# EAGLE design Adafruit RV-8803 RTC Breakout Board (EAGLE 9.6.2)
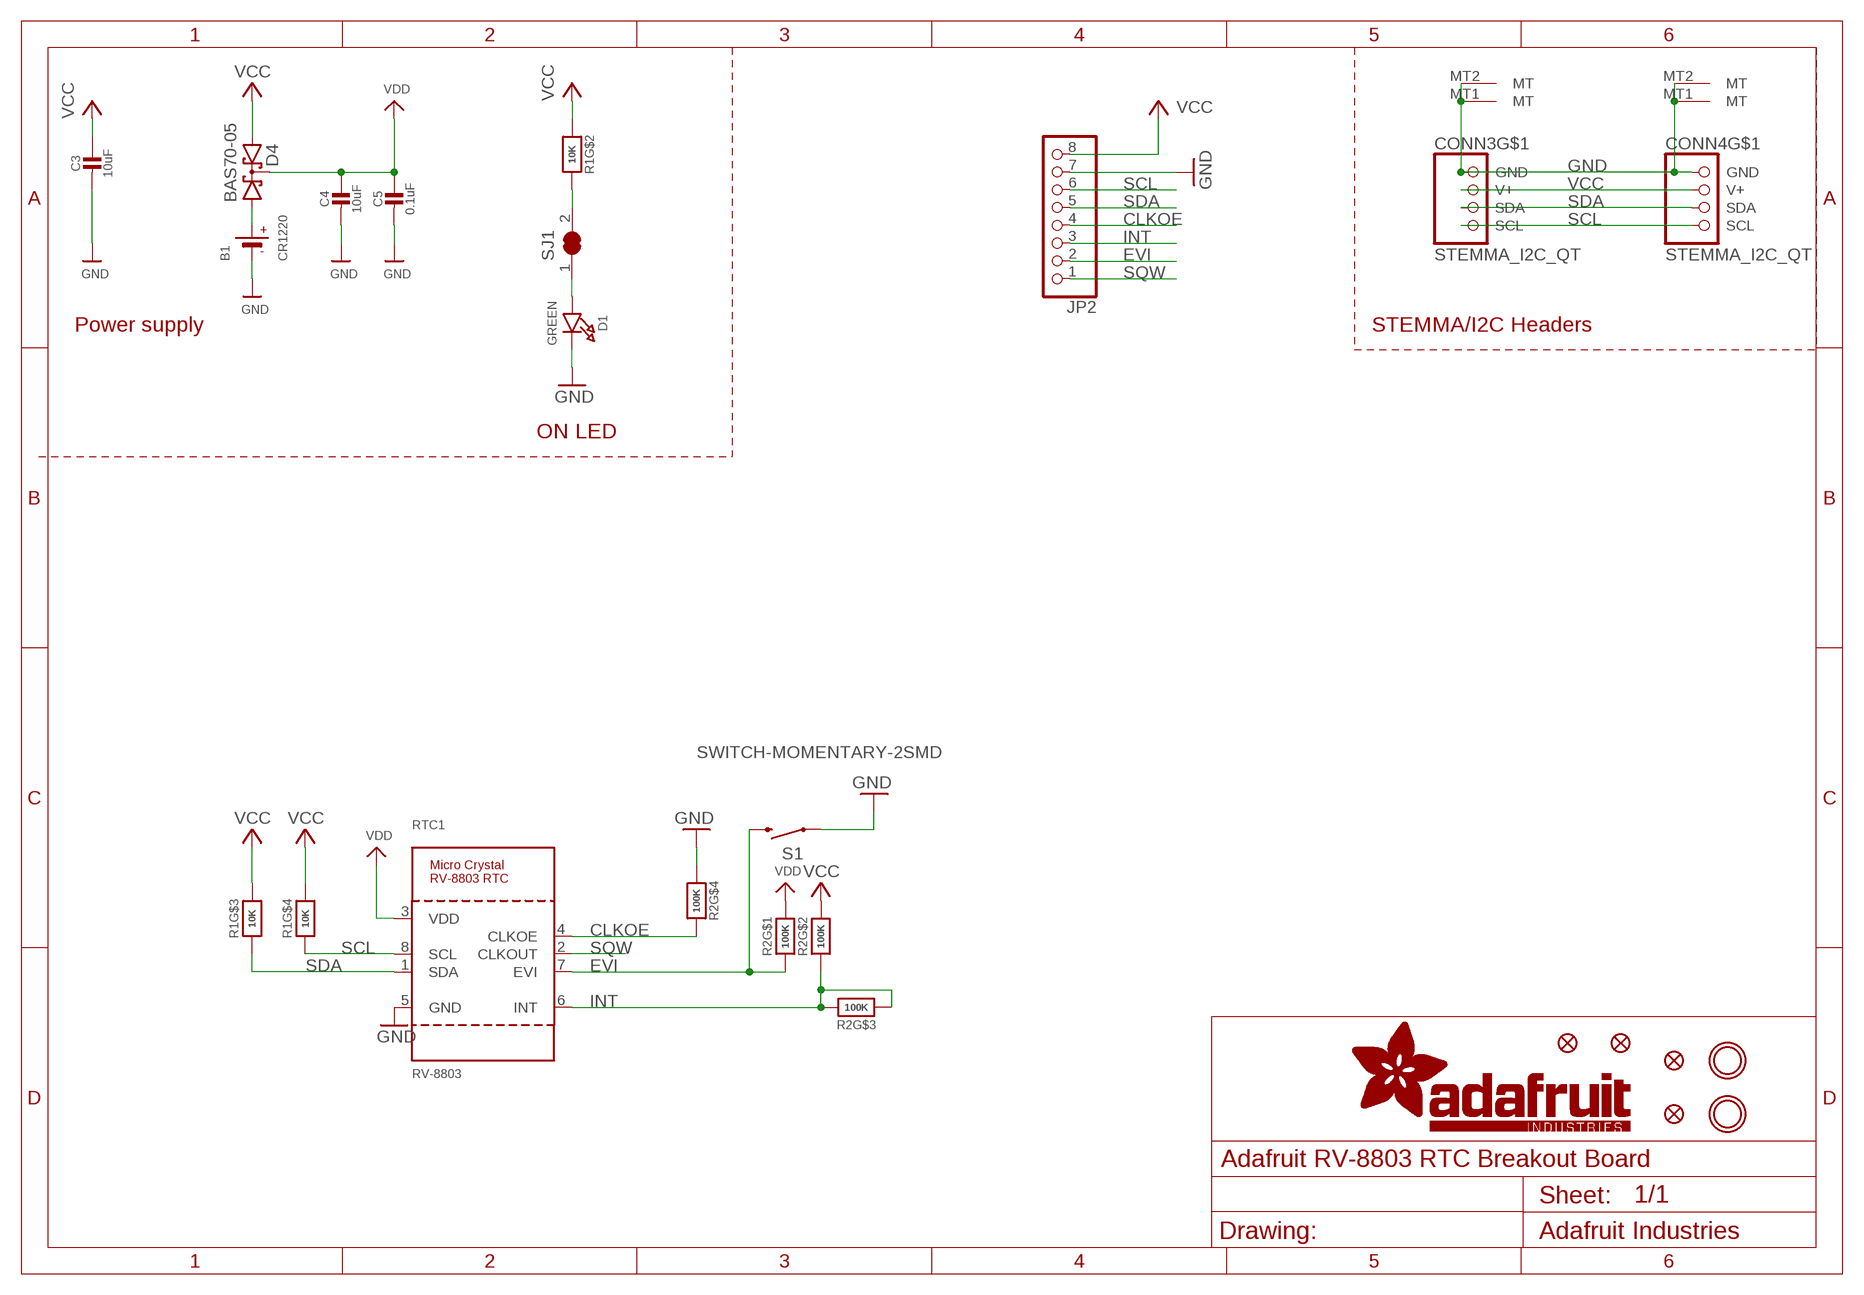
[diagram p0: schematic, sheet 1]

## Parts
B1  CR1220  BATTERYCR1220_SMT  [CR1220]
C3  10uF  CAP_CERAMIC0805-NOOUTLINE  [0805-NO]
C4  10uF  CAP_CERAMIC0805-NOOUTLINE  [0805-NO]
C5  0.1uF  CAP_CERAMIC0603_NO  [0603-NO]
CONN3  STEMMA_I2C_QT  [JST_SH4]
CONN4  STEMMA_I2C_QT  [JST_SH4]
D1  GREEN  LED0603_NOOUTLINE  [CHIPLED_0603_NOOUTLINE]
D4  BAS70-05  [SOT23]
FID1  FIDUCIAL_0.5MM  [FIDUCIAL_0.5MM]
FID2  FIDUCIAL_0.5MM  [FIDUCIAL_0.5MM]
FID3  FIDUCIAL_0.5MM  [FIDUCIAL_0.5MM]
FID4  FIDUCIAL_0.5MM  [FIDUCIAL_0.5MM]
JP2  HEADER-1X870MIL  [1X08_ROUND_70]
R1  10K  RESISTOR_4PACK  [RESPACK_4X0603]
R2  100K  RESISTOR_4PACK  [RESPACK_4X0603]
RTC1  RV-8803  [DFN8_RVRTC]
S1  SWITCH-MOMENTARY-2SMD  [TACTILE_SWITCH_SMD]
SJ1  SOLDERJUMPER_CLOSED  [SOLDERJUMPER_CLOSEDWIRE]
U$9  MOUNTINGHOLE2.5  [MOUNTINGHOLE_2.5_PLATED]
U$17  MOUNTINGHOLE2.5  [MOUNTINGHOLE_2.5_PLATED]

## Nets
CLKOE: JP2.4 R2.5 RTC1.4(CLKOE)
EVI: JP2.2 R2.1 RTC1.7(EVI) S1.3
GND: B1.- C3.2 C4.2 C5.2 CONN3.1(GND) CONN3.MT1(MT) CONN3.MT2(MT) CONN4.1(GND) CONN4.MT1(MT) CONN4.MT2(MT) D1.C JP2.7 R2.4 RTC1.5(GND) S1.1
INT: JP2.3 R2.2 R2.3 R2.6 RTC1.6(INT)
N$1: R1.7 SJ1.2
N$2: B1.+$1(+) B1.+$2(+) D4.1(A1)
N$4: D1.A SJ1.1
SCL: CONN3.4(SCL) CONN4.4(SCL) JP2.6 R1.4 RTC1.8(SCL)
SDA: CONN3.3(SDA) CONN4.3(SDA) JP2.5 R1.3 RTC1.1(SDA)
SQW: JP2.1 RTC1.2(CLKOUT)
VCC: C3.1 CONN3.2(V+) CONN4.2(V+) D4.2(A2) JP2.8 R1.2 R1.5 R1.6 R2.7
VDD: C4.1 C5.1 D4.3(CC) R2.8 RTC1.3(VDD)
Unconnected: R1.1 R1.8

## Notes on the sheet
- Power supply | STEMMA/I2C Headers
- ON LED

## Library data of the parts
B1 = microbuilder:BATTERY: CR1220 SMT - Digikey: 3001K-ND CD2032 BAT-HLD-001 - Digikey: BAT-HLD-001-ND
C3-C5 = microbuilder:CAP_CERAMIC: Ceramic Capacitors For new designs, use the packages preceded by an '_' character since they are more reliable: The following footprints should be used on most boards: _0402 - Standard footprint for regular board layouts _0603 - Standard footprint for regular board layouts _0805 - Standard footprint for regular board layouts _1206 - Standard footprint for regular board layouts For extremely tight-pitch boards where space is at a premium, the following 'micro-pitch' footprints can be used (smaller pads, no silkscreen outline, etc.): _0402MP - Micro-pitch footprint for very dense/compact boards _0603MP - Micro-pitch footprint for very dense/compact boards _0805MP - Micro-pitch footprint for very dense/compact boards _1206MP - Micro-pitch footprint for very dense/compact boards
CONN3 CONN4 = adafruit_electromech:STEMMA_I2C; LCSC: C2845363
D1 = microbuilder:LED: LED 0603 - 0603 Surface Mount Package 2mA: Green LED - Low Power (3.9mcd, 2ma, 1.7Vf) - Digikey: 475-2709-2-ND Orange LED - Low Power (9.8mcd, 2ma, 1.8Vf) - Digikey: 475-1194-2-ND Red LED - Low Power (5mcd, 2ma, 1.8Vf) - Digikey: 475-1195-2-ND Yellow LED - Low Power (7mcd, 2ma, 1.8Vf) - Digikey: 475-1196-2-ND 5mA: Blue LED - Low Power (17mcd, 5ma, 2.9Vf) - Digikey: LNJ937W8CRACT-ND 0805 - 0805 Surface Mount Package 2mA: Red LED (8.8mcd, 2mA, 1.8Vf, Clear) - Low Power [Digikey: 475-2510-1-ND] Green LED (5mcd, 2mA, 1.8Vf, Clear) - Low Power [Digikey: 475-2730-1-ND] Yellow LED (11.3mcd, 2mA, 1.8Vf, Clear) - Low Power [Digikey: 475-2555-1-ND] 20mA: Red LED (104mcd, 20mA, Diffused) - LS R976 [Digikey: 475-1278-6-ND] Red LED (12mcd, 20mA, 2.0Vf, Clear) - APT2012EC [Digikey: 754-1128-1-ND] Green LED (15mcd, 20mA, 2.2Vf, Clear) - APT2012GC [Digikey: 754-1131-1-ND] Orange LED (160mcd, 20mA, 2.1Vf, Clear) - APT2012SECK [Digikey: 754-1130-1-ND] 1206 - 1206 Surface Mount Package Green LED (26mcd, 20mA, Diffused) - LG N971 [Digikey: 475-1407-6-ND] Red LED (15mcd, 20mA, Diffused) - LH N974 [Digikey: 475-1416-6-ND] Cree - Cree High-Power Surface Mount LEDs XPEBWT-L1-0000-00D50 - White 111lm 350mA 2.9Vf 6200K 110° XTEAWT-00-0000-00000LEE3 - White 114lm 350mA 2.85Vf 5000K 115° Everlight - Everlight 45-21 Series Surface Mount LEDs 45-21/QK2C-B2832AC2CB2/2T - Warm White 2000mcd 20mA 3.25Vf 3050K 120° 45-21/LK2C-B38452C4CB2/2T - Nuetral White 2000mcd 20mA 3.25Vf 4150K 120° 45-21/LK2C-B50634C6CB2/2T - Cold White 2200mcd 20mA 3.25Vf 5650K 120° PLCC2 Reverse Mount LS T77K-J1L2-1-0-2-R18-Z - Red 11.25mcd 2mA 1.8Vf 630nm 120° LO T77K-L1M2-24-Z - Orange 19.6mcd 2mA 1.8Vf 606nm 120° LY T77K-K2M1-26-Z - Yellow 15.7mcd 2mA 1.8Vf 587nm 120°; ROT: 270
D4 = diode:BAS70-05: Schottky Diodes Source: Nexperia BAS70-05, SOT23, common cathode pins 1=A1, 2=A2, 3=K1/K2. https://assets.nexperia.com/documents/data-sheet/BAS70-05.pdf
FID1-FID4 = microbuilder:FIDUCIAL: Fiducial Alignment Points Various fiducial points for machine vision alignment.
JP2 = microbuilder:HEADER-1X8: PIN HEADER
R1 R2 = microbuilder:RESISTOR_4PACK: Resistor Packs (4 resistors) 4 x 0603 10K 1/16W - Digikey: YC164J-10KCT-ND
RTC1 = microbuilder:RV-8803
S1 = SparkFun:SWITCH-MOMENTARY-2
SJ1 = microbuilder:SOLDERJUMPER_CLOSED: Solder Jumper - Closed These solder jumpers are closed by default CLOSEDWIRE - 10 mil trace between pads that can be cut and resoldered later CLOSEDPERM - 63 mil trace between pads for a permanent connection (used to 'bridge' two signals, a shameless hack for Eagle). Can double as a test point as well (no cream layer)
U$9 U$17 = adafruit_electromech:MOUNTINGHOLE: Mounting Hole For #2 screws (0.086"/2.18mm width, 0.094"/2.4mm hole) use 2.5mm; BOM: EXCLUDE

## Net classes
1 highpower: width 0.305 mm, drill 0.483 mm
2 lowpower: width 0.254 mm, drill 0.483 mm

## Board
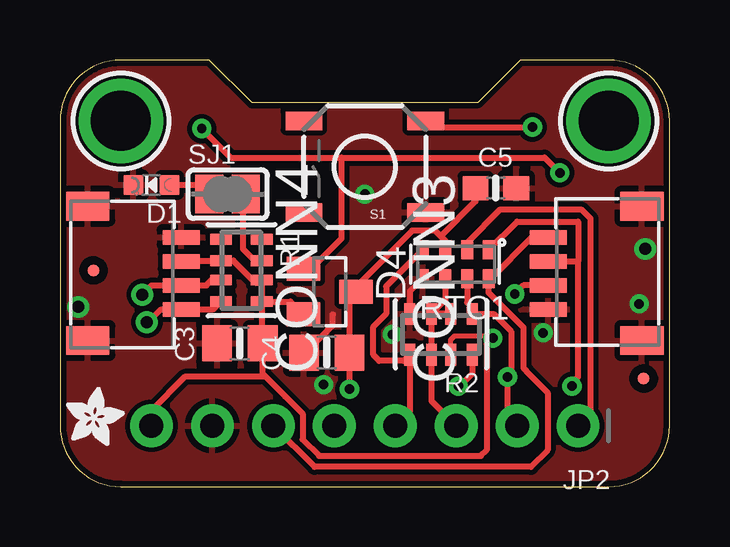
[diagram p1: board, top side]
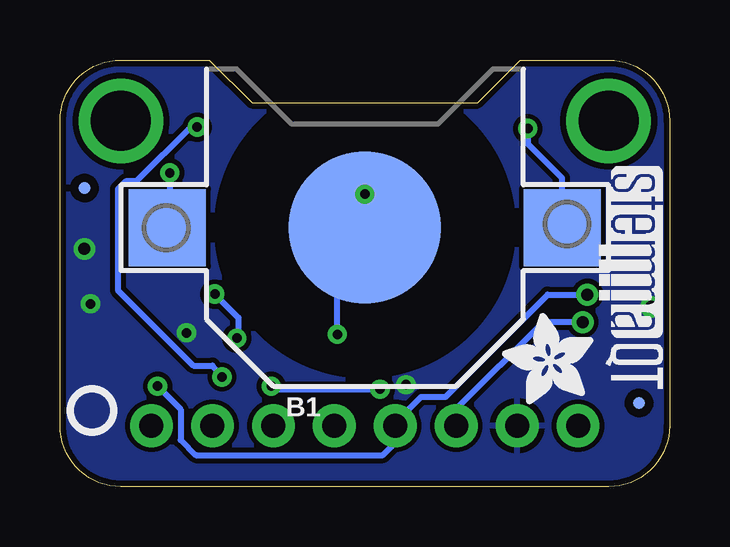
[diagram p2: board, bottom side, seen from below]

Size 25.4 x 17.78 mm. Coordinates in mm from the lower left corner, seen from the top.
Outline: 0,15.24 0,2.54 arc90 2.54,0 22.86,0 arc90 25.4,2.54 25.4,15.24 arc90 22.86,17.78 19.18,17.78 17.4,16 8,16 6.22,17.78 2.54,17.78 arc90 0,15.24
Copper layers (1*16): Top 0.035mm / dielectric 1.5mm / Bottom 0.035mm
Design rules "adafruit *": minimum track width 8mil, minimum drill 15.5mil, track to track 8mil, track to pad 8mil, pad to pad 8mil, via to via 8mil, smd to smd 8mil, copper to edge 10mil, drill to drill 8mil, minimum pad ring 10mil, minimum via ring 8mil, stop-mask expansion 2mil, vias tented up to drill 20mil, thermal gap 10mil

### Footprints (pad centres in the part's own frame; a part is rotated, then mirrored left to right if it is on the bottom)
CR1220 = smd 3.2 x 3.2: +$1 -8.225,0; +$2 8.225,0 | smd 6.35 x 6.35: - 0,0
0805-NO = smd 1.24 x 1.5: 1 -0.95,0; 2 0.95,0
0603-NO = smd 1.075 x 1: 1 -0.85,0; 2 0.85,0
JST_SH4 = smd 0.6 x 1.55: 1 -1.5,2.006; 2 -0.5,2.006; 3 0.5,2.006; 4 1.5,2.006 | smd 1.2 x 1.8: MT1 -2.8,-1.894; MT2 2.8,-1.894
CHIPLED_0603_NOOUTLINE = smd 0.8 x 0.8: A 0,-0.75; C 0,0.75
SOT23 = smd 1 x 1.4: 1 -0.95,-1.1; 2 0.95,-1.1; 3 0,1.1
FIDUCIAL_0.5MM = smd 0.5 x 0.5: 1 0,0
1X08_ROUND_70 = drill 1 pad 1.778: 1 -8.89,0; 2 -6.35,0; 3 -3.81,0; 4 -1.27,0; 5 1.27,0; 6 3.81,0; 7 6.35,0; 8 8.89,0
RESPACK_4X0603 = smd 0.45 x 0.9: 1 -1.3,-0.85; 2 -0.4,-0.85; 3 0.4,-0.85; 4 1.3,-0.85; 5 1.3,0.85; 6 0.4,0.85; 7 -0.4,0.85; 8 -1.3,0.85
DFN8_RVRTC = smd 0.5 x 0.8: 1 -1.35,-0.6; 2 -0.45,-0.6; 3 0.45,-0.6; 4 1.4,-0.6; 5 1.4,0.6; 6 0.45,0.6; 7 -0.45,0.6; 8 -1.35,0.6
TACTILE_SWITCH_SMD = smd 1.524 x 0.762: 1 -2.54,1.905; 2 2.54,1.905; 3 -2.54,-1.905; 4 2.54,-1.905
SOLDERJUMPER_CLOSEDWIRE = smd 1.168 x 1.6: 1 -0.762,0; 2 0.762,0 | smd 0.635 x 0.203: WIRE 0,0
MOUNTINGHOLE_2.5_PLATED = drill 2.5 pad 3.2: P$1 0,0

### Placement (x,y rotation side)
B1  12.7,10.79 0 bottom
C3  7.49,5.97 180 top
C4  11.11,5.59 180 top
C5  18.16,12.45 0 top
CONN3  22.35,8.89 90 top
CONN4  3.05,8.89 270 top
D1  3.81,12.57 90 top
D4  11.24,8.13 270 top
E$1  [ADAFRUIT_2.5MM]  0.25,1.71 0 top
FID1  1.27,3.49 0 bottom
FID2  24.38,12.45 0 bottom
FID3  1.4,9.02 0 top
FID4  24.32,4.51 0 top
JP2  12.7,2.54 180 top
PLABEL0  [PLABEL0]  3.68,4.19 0 top
PLABEL1  [PLABEL1]  6.48,0.89 0 top
PLABEL2  [PLABEL2]  8.89,4.19 0 top
PLABEL3  [PLABEL3]  11.56,0.89 0 top
PLABEL4  [PLABEL4]  19.05,4.19 0 top
PLABEL5  [PLABEL5]  17.97,14.48 0 top
PLABEL6  [PLABEL6]  0.25,12.45 0 top
PLABEL7  [PLABEL7]  16.64,1.02 0 top
PLABEL8  [PLABEL8]  21.59,0.89 0 top
PLABEL9  [PLABEL9]  13.97,4.19 0 top
PLABEL10  [PLABEL10]  4.83,14.99 0 top
PLABEL11  [PLABEL11]  13.34,10.03 0 top
PLABEL12  [PLABEL12]  24.89,5.97 0 bottom
PLABEL13  [PLABEL13]  11.43,1.02 0 bottom
R1  7.56,9.02 270 top
R2  15.88,6.35 180 top
RTC1  16.51,9.27 180 top
S1  12.7,13.34 180 top
SJ1  6.99,12.19 0 top
U$9  2.54,15.24 0 top
U$17  22.86,15.24 0 top
U$22  [ADAFRUIT_3.5MM]  3.17,3.43 90 bottom
U$25  [PCBFEAT-REV-040]  24.07,3.17 0 bottom
U$31  [STEMMAQT]  2.92,13.34 270 bottom

### Tracks (layer width: path | path; a pad name or v marks a point on that pad's centre or on a via)
CLKOE
  Top 0.254: RTC1.4 13.59,8.35 13.59,7.2 13.05,6.67 13.05,5.49 13.3,5.25 14.32,5.25 R2.5 14.57,3.15 JP2.4
EVI  (via drill 0.39)
  Top 0.254: RTC1.7 16.96,7.68 17.18,7.46 R2.1 18.06,7.2 18.8,6.47 18.8,4.57 v18.65,4.57 18.65,2.94 JP2.2 | S1.3 15.49,14.99 v19.68,14.99
  Bottom 0.254: v19.68,14.99 19.96,14.99 22.22,12.72 22.66,12.72 22.99,12.4 22.99,8.19 19.84,5.05 19.05,5.05 18.65,4.65 v18.65,4.57
GND  (via drill 0.39, 0.5)
  Top 0.254: RTC1.5 14.57,8.14 R2.4 | 11.37,7.18 11.36,7.17 11.36,6.73 10.22,5.59 C4.2
  Bottom 0.254: v12.7,12.19 12.7,11.05 | 12.7,11.05 B1.- | v13.84,6.35 13.84,9.91 12.7,11.05
  other vias: 0.76,7.49 24.38,9.91 10.99,4.25 24.13,7.62 20.13,6.41
  pour Top: 0,17.78 25.4,17.78 25.4,0 0,0
  pour Bottom: 0,17.78 25.4,17.78 25.4,0 0,0
INT
  Top 0.254: RTC1.6 16.06,7.79 R2.3 | R2.3 R2.6 15.47,3.58 JP2.3 | R2.2 R2.3
N$1
  Top 0.254: R1.7 8.11,9.42 7.62,9.91 7.62,12.06 SJ1.2
N$2  (via drill 0.39)
  Top 0.254: 11.73,13.72 7.11,13.72 v5.91,14.92 | D4.1 10.46,9.08 11.73,10.35 11.73,13.72 | 11.73,13.72 20.19,13.72 v20.83,13.08
  Bottom 0.254: v20.83,13.08 20.83,10.89 B1.+$1 | B1.+$2 4.47,12.86 5.91,14.29 v5.91,14.92
N$4
  Top 0.254: D1.A 5.84,12.57 SJ1.1
SCL  (via drill 0.5)
  Top 0.254: R1.4 6.38,7.39 CONN4.4 4.23,7.39 3.7,6.86 v3.62,6.86 | CONN3.4 20.32,10.41 19.68,10.41 17.94,8.67 RTC1.8 17.86,8.08 19.3,6.64 19.3,4.95 19.43,4.83 19.43,4.81 20.32,3.92 20.32,1.52 19.62,0.83 10.6,0.83 JP2.6
  Bottom 0.254: JP2.6 8.89,3.24 5.27,6.86 v3.62,6.86
SDA  (via drill 0.39, 0.5)
  Top 0.254: R1.3 6.69,8.64 6.35,8.64 6.1,8.39 CONN4.3 3.82,8.39 v3.43,8 | RTC1.1 17.87,9.87 19.05,11.05 21.58,11.05 21.58,11.04 21.58,9.39 | CONN3.3 21.58,9.39 | 21.58,9.39 21.58,4.56 21.34,4.32 v21.34,4.19
  Bottom 0.254: v3.43,8 5.08,8 9.34,3.75 10.35,3.75 11.43,2.67 JP2.5 11.43,1.84 11.95,1.32 19.74,1.32 20.37,1.96 20.37,3.23 v21.34,4.19
SQW
  Top 0.254: RTC1.2 16.96,10.16 18.35,11.56 21.72,11.56 22.1,11.18 22.1,3.05 JP2.1
VCC  (via drill 0.39)
  Top 0.203: R2.7 16.27,6.12 16.45,6.29 17.94,6.29 v18.03,6.19
  Top 0.254: CONN4.2 5.08,9.42 R1.2 7.22,9.42 8.13,8.51 8.41,8.51 | R1.6 8.41,8.51 | 8.41,8.51 R1.5 | R1.5 8.41,6 C3.1 8.44,4.7 8.57,4.57 | R1.5 9.6,7.72 D4.2 | 8.57,4.57 9.38,3.76 9.39,3.76 10.11,3.04 10.11,1.97 10.79,1.28 17.54,1.28 17.78,1.52 17.78,5.94 v18.03,6.19 | CONN3.2 19.31,8.39 v18.95,8.03 | 8.57,4.57 5.21,4.57 3.81,3.17 JP2.8
  Bottom 0.254: v18.95,8.03 17.97,7.05 17.97,6.25 v18.03,6.19
VDD  (via drill 0.39)
  Top 0.254: RTC1.3 16.06,10.24 15.86,10.44 | 15.86,10.44 15.63,10.67 14.67,10.67 12.34,8.34 D4.3 12.06,7.85 C4.1 v12.06,4.06 | C5.1 17.31,11.89 15.86,10.44 | R2.8 17.18,4.7 16.66,4.19 v16.6,4.19
  Bottom 0.254: v16.6,4.19 16.47,4.06 v12.06,4.06

### Text on the board
Pinguin_tBackup: RV / 8803 | Prec. / RTC | on | EVI | VIN | SCL | CLOE | EVI | GND | SDA | INT | SQW
Pinguin_bBackup: CR1220 / 3V Batt | VLogic/Vcc: 3-5V